# Altium project DfPlayer_board.PrjPcb
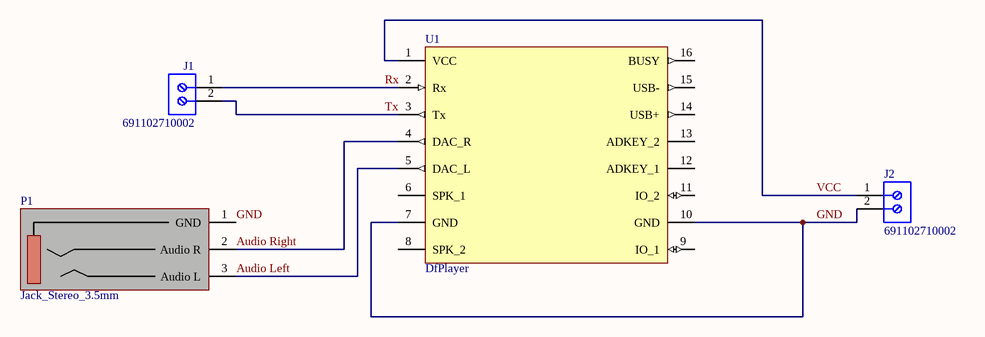
[diagram p0: DfPlayer_board.SchDoc]
1 sheet, 4 parts. Net scope: global (net labels, ports and power ports of the same name join across sheets).
Board file: DfPlayer_board.PcbDoc

## Sheet DfPlayer_board.SchDoc
size A4; SheetNumber: 1; SheetTotal: 1

### Parts
J1  691102710002  [691102710002]
J2  691102710002  [691102710002]
P1  Jack_Stereo_3.5mm  [CUI_SJ1-3515]
U1  DfPlayer  [DFPLAYER_MINI_MP3]

### Nets
Audio Left: P1.3(Audio_L) U1.5(DAC_L)
Audio Right: P1.2(Audio_R) U1.4(DAC_R)
GND: J2.2 P1.1(GND) U1.7(GND) U1.10(GND)
Rx: J1.1 U1.2(Rx)
Tx: J1.2 U1.3(Tx)
VCC: J2.1 U1.1(VCC)

Not connected (* = marked no-connect by the designer): U1 6(SPK_1) 8(SPK_2) 9(IO_1) 11(IO_2) 12(ADKEY_1) 13(ADKEY_2) 14(USB+) 15(USB-) 16(BUSY)

### Library data of the parts
J1 J2 = CMP-1502-03258-3: 102 Series 5MM Pitch Straight, Pcb Terminal Block, Through Hole, 2 Way; Current Rating: 15A; Wire/Cable Gauge: 22AWG; Voltage: 300V; Number of Positions Per Level: 2; Plating: Steel; Stripping Length: -6mm; Wire Gauge (Min): 14AWG; Number of Levels: 1; Pitch: 5.0038mm; Width: 11.2mm; Max Operating Temperature: 105°C; Contact Material: Brass; Contact Plating: Tin; Current: 15A; Wire Gauge (Max): 22AWG; Mount: Through Hole; Length: 7.5mm; Min Operating Temperature: -40°C; RoHS: Compliant; Color: Blue; Number of Pins: 2; Housing Material: Nylon; Termination: Screw; Height: 13.4mm; Number of Contacts: 2; Lead Pitch: 5mm; Voltage Rating: 300V; Packaging: Box
P1 = Jack_Stereo_3.5mm: Conector Jack stereo 3.5mm sin microfono
U1 = DfPlayer: Header for DfPlayer mini MP3 2x8 pins